# Altium project Battery_Monitor_V2.PrjPcb
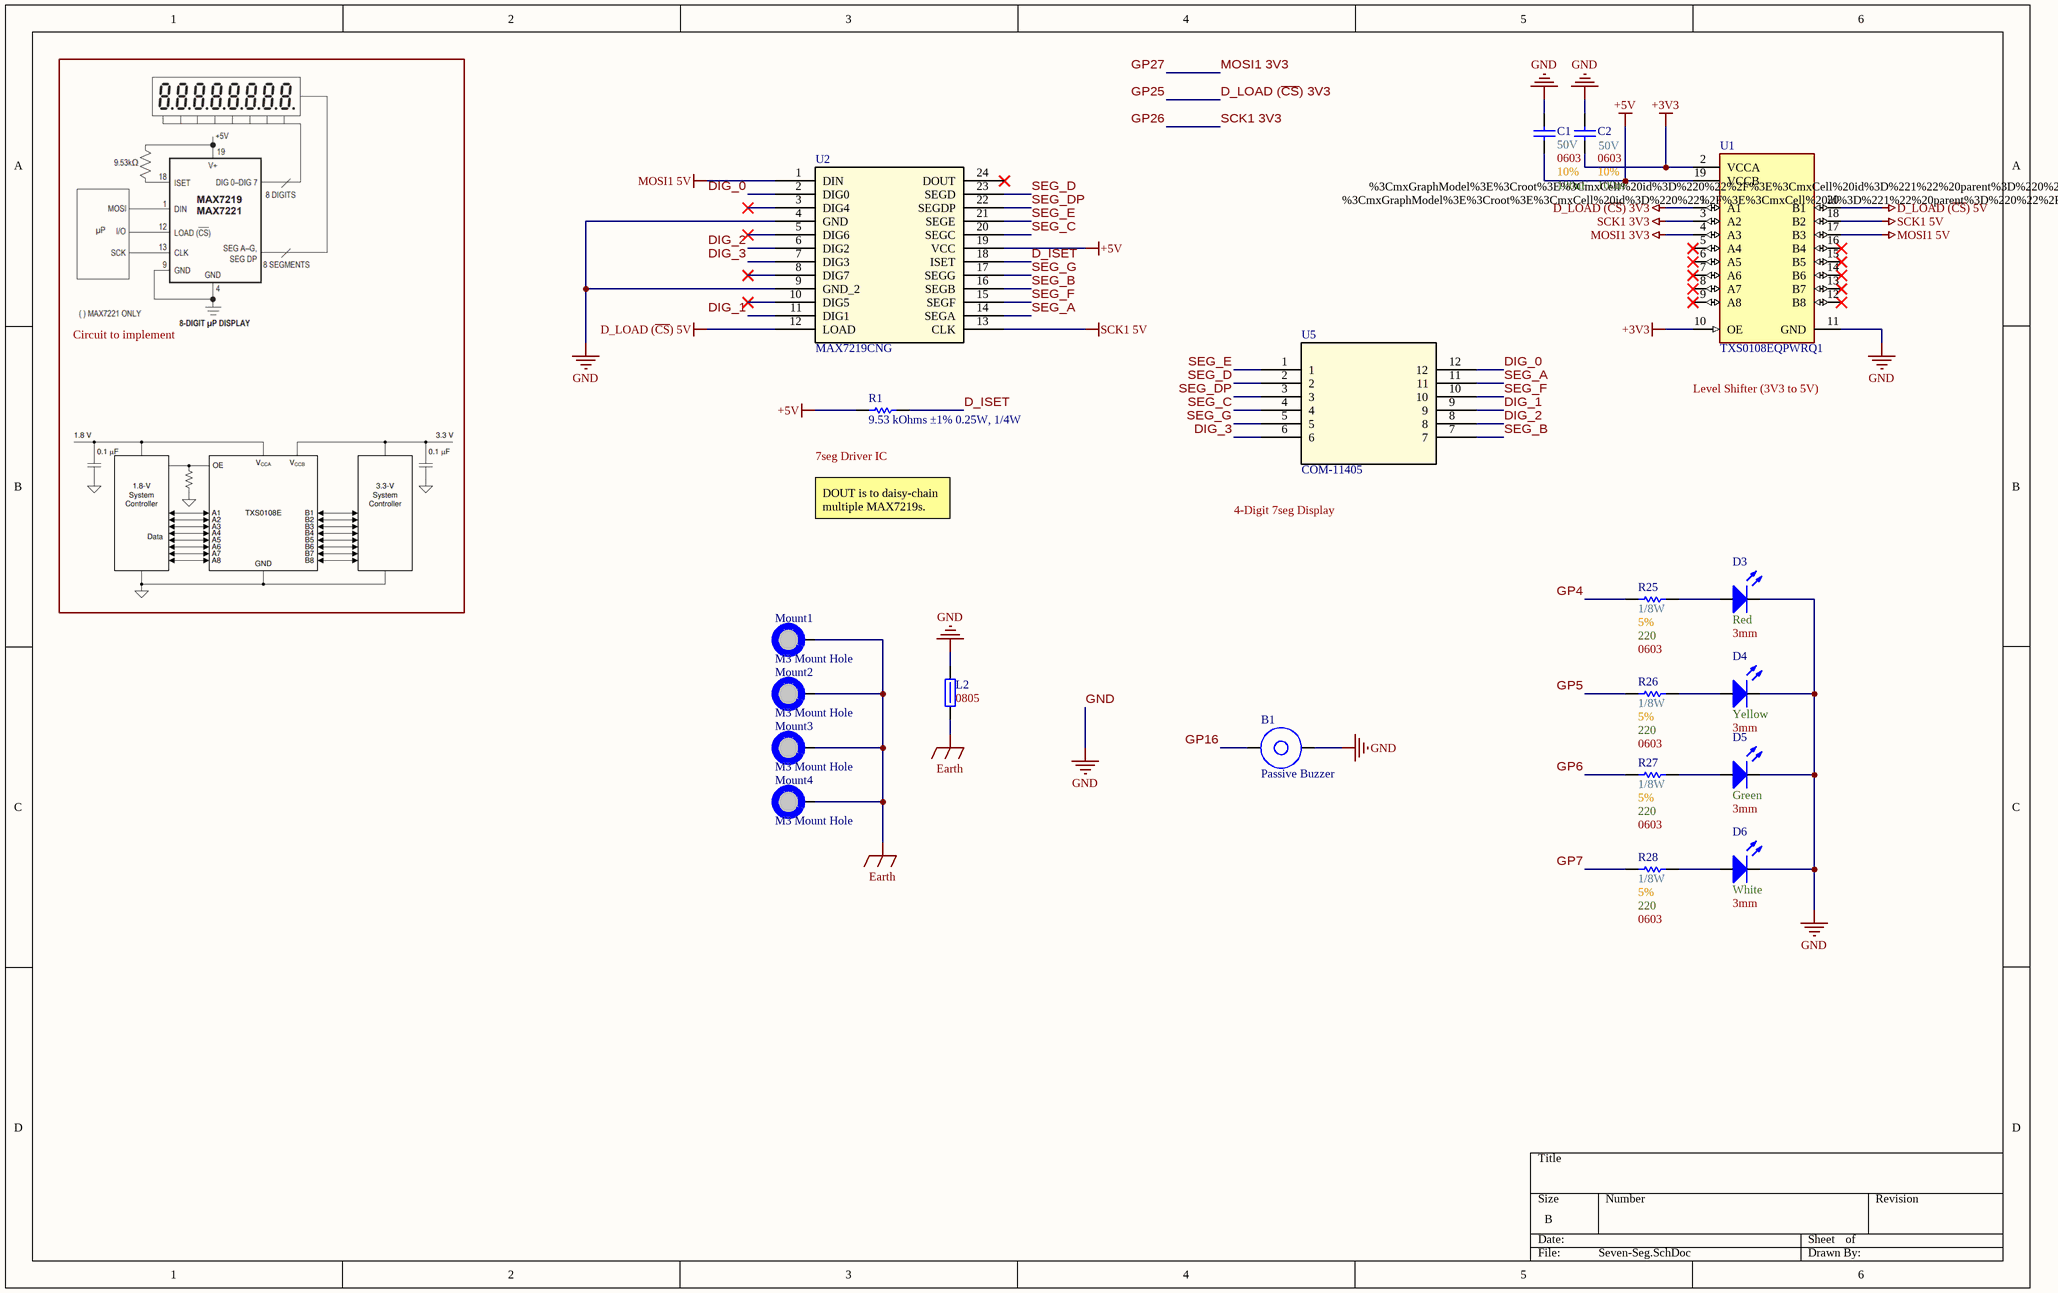
[diagram p0: Seven-Seg.SchDoc]
4 sheets, 99 parts. Net scope: global (net labels, ports and power ports of the same name join across sheets).
Board file: PCB1.PcbDoc
Sheets:
  Seven-Seg.SchDoc
  Battery-Voltage.SchDoc
  RP2350A.SchDoc
  Battery-Current.SchDoc

## Sheet Seven-Seg.SchDoc
size B; SheetNumber: 1; SheetTotal: 4

### Parts
B1  Passive Buzzer  [[Buzzer] Passive Thru-Hole 3V 30mA]
C1  Max Voltage: 50V  Size Package: 0603  Tolerance: 10%  Capacitance: 100nF  [[Cap] SMD 0603]  (hidden comment: [Cap] 0603 0.1uF 10% 50V)
C2  Max Voltage: 50V  Size Package: 0603  Tolerance: 10%  Capacitance: 100nF  [[Cap] SMD 0603]  (hidden comment: [Cap] 0603 0.1uF 10% 50V)
D3  Color: Red  Lens Diameter: 3mm  [[LED] Thru-Hole 3mm Red]  (hidden comment: [LED] Thru-Hole 3mm Red)
D4  Color: Yellow  Lens Diameter: 3mm  [[LED] Thru-Hole 3mm Yellow]  (hidden comment: [LED] Thru-Hole 3mm Yellow)
D5  Color: Green  Lens Diameter: 3mm  [[LED] Thru-Hole 3mm Green]  (hidden comment: [LED] Thru-Hole 3mm Green)
D6  Color: White  Lens Diameter: 3mm  [[LED] Thru-Hole 3mm White]  (hidden comment: [LED] Thru-Hole 3mm White)
L2  Size Package: 0805  [[Ferrite] SMD 0805]  (hidden comment: 652-MH2029-300Y)
Mount1  M3 Mount Hole  [[Mount] M3 Mount Hole]  (no BOM)
Mount2  M3 Mount Hole  [[Mount] M3 Mount Hole]  (no BOM)
Mount3  M3 Mount Hole  [[Mount] M3 Mount Hole]  (no BOM)
Mount4  M3 Mount Hole  [[Mount] M3 Mount Hole]  (no BOM)
R1  9.53 kOhms ±1% 0.25W, 1/4W  [RESC2013X60X30LL20T20]
R25  Wattage: 1/8W  Tolerance: 5%  Resistance: 220  Size Package: 0603  [[Res] SMD 0603]  (hidden comment: [220] SMD 0603 5% 1/10W)
R26  Wattage: 1/8W  Tolerance: 5%  Resistance: 220  Size Package: 0603  [[Res] SMD 0603]  (hidden comment: [220] SMD 0603 5% 1/10W)
R27  Wattage: 1/8W  Tolerance: 5%  Resistance: 220  Size Package: 0603  [[Res] SMD 0603]  (hidden comment: [220] SMD 0603 5% 1/10W)
R28  Wattage: 1/8W  Tolerance: 5%  Resistance: 220  Size Package: 0603  [[Res] SMD 0603]  (hidden comment: [220] SMD 0603 5% 1/10W)
U1  TXS0108EQPWRQ1  [FP-PW0020A-MFG]
U2  MAX7219CNG  [21-0043D_24_MXM]
U5  COM-11405  [COM-11405_SPK]

### Nets
+3V3: C2.1 U1.2(VCCA) U1.10(OE)
+5V: C1.1 R1.1 U1.19(VCCB) U2.19(VCC)
D_LOAD (~{CS}) 3V3: U1.1(A1)  [also labelled GP25]
D_LOAD (~{CS}) 5V: U1.20(B1) U2.12(LOAD)
Earth: L2.2 Mount1.1 Mount2.1 Mount3.1 Mount4.1
GND: B1.2(-) C1.2 C2.2 D3.2(Cathode) D4.2(Cathode) D5.2(Cathode) D6.2(Cathode) L2.1 U1.11(GND) U2.4(GND) U2.9(GND_2)
MOSI1 3V3: U1.4(A3)  [also labelled GP27]
MOSI1 5V: U1.17(B3) U2.1(DIN)
SCK1 3V3: U1.3(A2)  [also labelled GP26]
SCK1 5V: U1.18(B2) U2.13(CLK)
D_ISET: R1.2 U2.18(ISET)
DIG_0: U2.2(DIG0) U5.12
DIG_1: U2.11(DIG1) U5.9
DIG_2: U2.6(DIG2) U5.8
DIG_3: U2.7(DIG3) U5.6
GP4: R25.1
GP5: R26.1
GP6: R27.1
GP7: R28.1
GP16: B1.1(+)
SEG_A: U2.14(SEGA) U5.11
SEG_B: U2.16(SEGB) U5.7
SEG_C: U2.20(SEGC) U5.4
SEG_D: U2.23(SEGD) U5.2
SEG_DP: U2.22(SEGDP) U5.3
SEG_E: U2.21(SEGE) U5.1
SEG_F: U2.15(SEGF) U5.10
SEG_G: U2.17(SEGG) U5.5
NetD3_1: D3.1(Anode) R25.2
NetD4_1: D4.1(Anode) R26.2
NetD5_1: D5.1(Anode) R27.2
NetD6_1: D6.1(Anode) R28.2

Not connected (* = marked no-connect by the designer): U1 5(A4)* 6(A5)* 7(A6)* 8(A7)* 9(A8)* 12(B8)* 13(B7)* 14(B6)* 15(B5)* 16(B4)*; U2 3(DIG4)* 5(DIG6)* 8(DIG7)* 10(DIG5)* 24(DOUT)*

### Notes on the sheet
- %3CmxGraphModel%3E%3Croot%3E%3CmxCell%20id%3D%220%22%2F%3E%3CmxCell%20id%3D%221%22%20parent%3D%220%22%2F%3E%3CmxCell%20id%3D%222%22%20parent%3D%221%22%20style%3D%22shape%3Dimage%3BverticalLabelPosition%3Dbottom%3BlabelBackgroundColor%3Ddefault%3BverticalAlign%3Dtop%3Baspect%3Dfixed%3BimageAspect%3D0%3Bimage%3Ddata%3Aimage%2Fpng%2CiVBORw0KGgoAAAANSUhEUgAAAL4AAADECAYAAAAhzZs6AAAAAXNSR0IArs4c6QAAAARnQU1BAACxjwv8YQUAAAAJcEhZcwAAEnQAABJ0Ad5mH3gAABu5SURBVHhe7d17WFT1vsfxjzMKhEPAcGdUrnJRA4EIEy%2Bp%2B1jtNgTm8QiashMlE3aJJngShK2BYiFna7azsq25rUzzqVQ6bjUuSSpIQjvTyUE4KVchLiK3mfmePwaRWQmSghrr%2B3qeeXqe9Vuz1tB6z%2FSbH9oaQkSEQaSwsBCRkZEoLCwUDg0agYGBSEtLQ2BgoHCI9ZFEuIExMeDwmShx%2BEyUOHwmShw%2BEyUOn4lSn8LXNpSiIPsYvj5dggaNcFRHW%2F09ck5fwjWtcIQ9CNrrlDh1%2FCiOn1SiVn1zu%2FZaJVRKJZRKJZRKFcoqG9BtGGitQamqovuWTu1oamoTbuykxbVKVecxlVCVVaC%2Bvdvw9RpcUl1CzfVu2wBcr74EVWktWvU3DwzqlZrKPnuJ%2FGzs6ZFpM2mKpw1Z%2BkbT51c0gt1U9M4fLWmoTQR90aI%2FdK%2BdOXOGfHx8hJsHlYkTJ9I333wj3NyDJsrPCKXRchtyD5hEEzztSO4aQptPNxERUfO%2BMDIfZkK2Do7k6OhACrmMzN2epoTMclITUVvuK%2BQmC%2Bk6WltVIe1%2FI5qCvRXkvfIEtXU7003NtC%2FMnIaZ2JKDoyM5KCzJxNSBnnh5P5Woiagpl1aMk5F7zFFq7HyGpi6TokbLyOe1b6lZcLSB0Hv4LV%2FREgd7Ct15mTRERK1FlOxvQr5JRdTRtZOaSt8PIQfZQyTl8O%2BJ3xK%2BWpVOU008aNnROt011DTSqQR%2FMhufQPltuvAt7BfRwRvXTV1LJ5Ink7ldOH1aq9EPv%2BUgRbqMoseei6bwR03JY0Vv4VuQ%2FaKDpDushpqKM%2BgpG0t6bvdV0pCG6v%2B1jNxNvGl1XjMRNVHOinFkMjaWsnTvxwHX%2B1RHLcfkpSlYFWynmxMZusHLwxhNtb%2FgxoxH8%2FNHWLmhGn9eH44RUv2ns%2FtPU1WOKq0d3NxMdddQYgK%2FqFSkzB0HA%2BHOACCVY2L085jQWIC8c3qTHsBgGjafLcGpfRsR6jpMf6xXEsjGPo9Zvtdx%2FnsV1JDAdHoyNs1pxNsrMlDw7SYsf68N899Yg8ky4XMHRu%2Fhy%2FwxP24hJpjpdtNWH8L%2BHBNMD%2FKDIQBoK7Av7q%2F4v7AMvDxmqPDZ7AFg4BuOBT5FSAqaj3W7c6Cq10CqmIGlcXPgdcvygevnzqMUlrC1FnySSYwhk93Zp5v68mEcKTaG2xhHDAUAiQWeeX0TnrmShqeCNqN21iYkzzS%2FTZD9p%2B%2FnUSvxQVQs8qakYu0MGQAtqg%2BsRsKFWUhf5Y%2BHhPuzB4OhD%2BIyc7E9RIIjiUHwHOGMKYu3IK%2Fm5iqEtiYbW5bHICYmGi9GBCFw1g5II%2BKxwPXOItfRouqLVzHzial4zNUMRk4xuPjHLUgLt%2B6KTmLzNF74kwXq623xbMSTsOp7jXetb6fSViMzdg6S6pZgz7bZsJMA2pqDWB2Xg0dj5sLqihIXy67ievNVlKlKUXNPvpazvpLIxmB20m7kllRAeWgNxhUnIyhsKy50rdAZQW6vgEIxEq5%2BoVj7ZTHytwbBtm919GioxyzErUnA2qgpsBo%2BDuHLZ8O128Sg%2Fd9vIWlPKzw9GrEz6W38KJhZDSjhpP%2FXrlH%2Bhmk00msZHay8uZrT8sXL5PfII%2FRI52PsSDOSSMxopFcwvVl086vvvcZfbrtT05Uv19FLb35N9d0W4tpyl5Pb8CfpnWrNr7%2FcCghXdXSa6dO5ln3%2Fcqsppw9n2ZIifC9V3Xgd6gu05Q8WZPvcLipTvUt%2FsrakJ7ddJLX%2BgQbMbd7Taqh2RiDsPWusP5CBZ2xu7m4UlIGC4mIUdz7OvP9fGGkbgrdOfY5YL57vPxikMDWqwJGURKTnVurW57UNKM4qQLW1C1wevs3l7y8SO8xdEwWbQ68jI78VgAaXdsRiXZE%2FktLCMcr5z3jjNW%2FkJ6%2FArrIeflHUz3r%2FyduOYeOaAyj9%2BTD%2B4mcFc3Nz3cNuPvYKfvnAHkzDp2%2FAxykuyAzzgM1IFzgrHDBzlxli31%2BLaYbCvQfOUO8Y%2FHfQVbyTvBOq0j1YufYExsSnY5GzFIAU7i9uxirXLCSs2ovye%2FBL0CHEfxHld%2BfO%2FiJKK%2BrKylCttYSjkwWMhMMi0%2FsnPhtEjCB3cIcHRw9w%2BEysOHwmShw%2BEyUOn4kSh89EicNnosThM1Hi8JkocfhMlDh8JkocPhMlDp%2BJEofPRInDZ6LE4TNR4vCZKHH4TJQ4fCZKHD4TJQ6fiRKHz0SJw2eixOEzUeLwmShx%2BEyUOHwmShw%2BEyUOn4kSh89EicNnosThM1Hi8JkocfhMlDh8JkocPhMlDp%2BJEofPRInDZ6LE4TNR4vCZKHH4TJQ4fCZKHD4TJQ6fiRKHz0SJw2eiNOTAgQMk3Ph7plKp8NZbbyE9PV04NGjEx8dj4cKF8PT0FA6xPhry7LPPDqrw6%2BvrcfbsWTzxxBPCoUEjJycHY8eOhYWFhXCI9dEQIhpU4RcWFiIyMhKFhYXCoUEjMDAQaWlpCAwMFA6xPuI5PhMlDp%2BJEofPRInDZ6LE4TNR4vCZKHH4TJQ4fCZKfQpf21CKguxj%2BPp0CRo03QeuoVKlhFJ583GxvAHabruwB0N7nRKnjh%2FF8ZNK1Kpvbtdeq4Sq6%2FqpUFbZgG7DQGsNSlUV3bd0akdTU5tw46%2B0VZ1D3rHjyPmuDE2%2FCqMddcpTOH70OE4qa%2FXPO9CoV2oq%2B%2Bwl8rOxp0emzaQpnjZk6RtNn1%2FR6IabPqQQmQE9ZGpGZma6h%2FXsnfSL8DD30JkzZ8jHx0e4eVCZOHEiffPNN8LNPWii%2FIxQGi23IfeASTTB047kriG0%2BXQTERE17wsj82EmZOvgSI6ODqSQy8jc7WlKyCwnNRG15b5CbrKQrqO1VRXS%2FjeiKdhbQd4rT1BbtzPp0VTQV2um00hzBT3y%2BETydZKTpc8S%2BkSl1o035VNG6GiS27hTwKQJ5GknJ9eQzdT5sgZc7%2BG3fEVLHOwpdOdl0hARtRZRsr8J%2BSYVUQcRqX%2FaSIEWs%2Bmja8In3j8cvj61Kp2mmnjQsqN1umuoaaRTCf5kNj6B8tt04VvYL6KDLTeeUEsnkieTuV04fVqr0Q%2B%2F5SBFuoyix56LpvBHTcljRU%2Fha6j8w%2BfIThFMb%2F%2FQeeCOMto9ZwRZBX9AVzRqUqVPJROPZXS0Tvchqmk8RQn%2BZjQ%2BIV%2F%2FUAOk96mOWo7JS1OwKthONycydIOXhzGaan%2BBBoCmogJXLexhN1T4RPag0FSVo0prBzc3U901lJjALyoVKXPHwUC4MwBI5ZgY%2FTwmNBYg75xg8mEwDZvPluDUvo0IdR2mP9ad9go%2B%2B8cRWEUk4oUxRrptQ0fhP1fG4g%2BG1Sjt0KCqvApaOze4meoSlJj4ISo1BXPHGUBzaReiglbhb1tfxAwvFziPfQJL%2FvEDWvXPcld6D1%2Fmj%2FlxCzHBTLebtvoQ9ueYYHqQHwwBqCsrUV2bieVedjC3csKjczYgq%2FpXEzl2Hxn4hmOBTxGSguZj3e4cqOo1kCpmYGncHHjdsnzg%2BrnzKIUlbK2l%2BgMSY8hkgm230vETzpUMhYeXp96by8B%2FOfbsXYWJhgbwDV8An6IkBM1fh905KtRrpFDMWIq4OV6g5lKc%2Bd%2B38N5Zf6z9%2BDA%2BjDTBoRVr8dkv%2FddW7%2BF3p1big6hY5E1JxdoZMt02p%2BlYMD8SSXvzUHD4dQRcTMX8V79AP74%2BdrcMfRCXmYvtIRIcSQyC5whnTFm8BXk1Ny%2BStiYbW5bHICYmGi9GBCFw1g5II%2BKxwLUPkd8KtaKt3QCGhj3nZegTh8zc7QiRHEFikCdGOE%2FB4i156HpZhlMRk7YIU8a4I%2FCFWfBtL8VPl%2FsvrJ5fWXfaamTGzkFS3RLs2TYbdp3PMn50MTIyViHY2wku%2FuHYuCYY2uxMFHQID8DuJ4lsDGYn7UZuSQWUh9ZgXHEygsK24kLXCp0R5PYKKBQj4eoXirVfFiN%2FaxBs%2B1bHrw0xhrFRG643d18CFJJANmY2knbnoqRCiUNrxqE4OQhhWy90jkshvfG%2BGyqFFFpo%2B6%2F7voTfjIJNcxGVPQl%2F37saAZ0f9kA7Lhx%2BHwfO3ly%2BHGZqAqOOdrQOqj%2Fh%2F3umQfnB9ViWnoUGLQAYw3HqYmS8uQCWJw8ju0535SRWAZj3ajzi4%2BOwMuYFhASMROfM%2FM4M84SXO%2FDvM9%2Bhvdvm1uOrMXnSanx9vRwH1y9DelZnO8aOmLo4A28usMTJw9ndnjFwbhO%2BGqqdEQh7zxrrD2TgGRv93Rvz%2FoYXX%2F0A59sAaGtw7JNjaPB%2BHL49zB3ZvSaFqVEFjqQkIj23UrdOrm1AcVYBqq1d4PLwbS7%2FnZJYIXRxMFp3JyI9vx5aANqmImzbsANlLgEYb2QKo4ojSElMR26l7gu0tqEYWQXVsHZxER5tQPT%2Bk7cdw8Y1B1D682H8xc8K5ubmuofdfOy9bgC%2FFVvx8tD%2FwVQnN3g6e%2BD5XD%2BkbloARe9HZffQ8Okb8HGKCzLDPGAz0gXOCgfM3GWG2PfXYpqhcO%2F%2BIoFF8P%2Fg43g5PnzKCSOcXaEY9QS2Gy%2FHP9ODYS4ZjukbPkaKSybCPGww0sUZCoeZ2GUWi%2FfXThMebGAI1zd%2FOw01V5XQhYtV9CAs5%2FM6fk9aqLb0PP1YcpVuLNnfEy3VVPLjOSqp7uGsLbVUev5HKrnaw%2FgA6YfPZgmMrZ3g5mKN4cIh9gAxgtzBHR5OFnc3f%2F%2BtjKzg5OEJJ6sezmokh4O7B5wsehgfIP0QPmO%2FPxw%2BEyUOn4kSh89EicNnosThM1Hi8JkocfhMlDh8JkocPhMlDp%2BJEofPRInDZ6LE4TNR4vCZKHH4TJQ4fCZKHD4TJQ6fiRKHz0SJw2eixOEzUeLwmShx%2BEyUOHwmShw%2BEyUOn4nSEKlUOqj%2Bb%2FZEBK1WC2nXXQUGH41GA4lEgiFDhgiHWB8N6ejoGFThFxYWIioqCvn5%2BcKhQWPKlClITU1FYGCgcIj10RAiGnThR0ZGorCwUDg0aAQGBiItLY3Dvws8x2eixOEzUeLwmShx%2BEyUOHwmShw%2BEyUOn4lSn8LXNpSiIPsYvj5dgoYe7tKubqrElZrmrrucswdLe50Sp44fxfGTStTq7qkMANBeq4RKqYRSqYRSqUJZZYPuRtA3tNagVFXRfUundjQ1tQk36muvg%2FLUcRw9fhLK7ift0oaqc3k4djwH35U13WxHew2VqhJUNXevqQ11ZRehqrzWP40J7%2F%2BpT01ln71Efjb29Mi0mTTF04YsfaPp8yuarj2ainfSsmnOZCaTk%2FerX1Or3vPvPb7PrVAT5WeE0mi5DbkHTKIJnnYkdw2hzaebiIioeV8YmQ8zIVsHR3J0dCCFXEbmbk9TQmY5qYmoLfcVcpOFdB2traqQ9r8RTcHeCvJeeYLaup2pu6b8DAodLScb9wCaNMGT7OSuFLL5NOnOSqSp%2BIrWTB9J5opH6PGJvuQktySfJZ%2BQSk1EzfsozMKeFh28ce%2FbDir5MIycLCdQYu4vdLO%2BO9d7%2BC1f0RIHewrdeVl3stYiSvY3Id%2BkIuogIk31fopwtKepr31JF5v64%2BXcPQ5fn1qVTlNNPGjZ0TrdNdQ00qkEfzIbn0D5bbrwLewXUVdj6lo6kTyZzO3C6dNajX74LQcp0mUUPfZcNIU%2FakoeK3oIX62i9Kkm5LHsKNXpTkqNpxLI32w8JeS3EWnK6cPn7EgR%2FDb90HnejrLdNGeEFQV%2FcIU0euFrqPrIKzRe7kaLPrtMasGp7lTvUx21HJOXpmBVsJ1uTmToBi8PYzTV%2FgINNFDueBOZHonYlfwnuMh6PxS7PzRV5ajS2sHNzVR3DSUm8ItKRcrccTAQ7gwAUjkmRj%2BPCY0FyDsnmJ4YTMPmsyU4tW8jQl2H6Y91p6lCeZUWdm5uMNWdFCZ%2BUUhNmYtxBoD2ymf4xxErRCS%2BgDGd93UeOuo%2FsTL2DzCsLkVHt0M1f%2Fcm5j7%2FCeyS92NrqAL99UcPe69V5o%2F5cQsxwUy3m7b6EPbnmGB6kB8MtXX4Jvt7yKV5WOzjAGsbZzy%2BcBsKmvplBsb6iYFvOBb4FCEpaD7W7c6Bql4DqWIGlsbNgdctyweunzuPUljC1lqQmcQYMlkf0jPwRfgCHxQlBWH%2But3IUdVDI1VgxtI4zPEyQMdP51Ay1ANent1fgAH8l%2B%2FB3lUTYdi5RXN5DxbNSkZN%2BD%2Fxz5fG9esd2XsPvzu1Eh9ExSJvSirWzpAB2nL8XNmKyxUmWLjzW1w4vRUTf3gNC9edxG2%2B8rB7ydAHcZm52B4iwZHEIHiOcMaUxVuQV3PzA0pbk40ty2MQExONFyOCEDhrB6QR8Vjg2ofIb8kQPnGZyN0eAsmRRAR5joDzlMXYklcDLQBqbUO7gSEMe6tPW4mPXl6GvWXtaGlsRLtw%2FC71duqbtNXIjJ2DpLol2LNtNuwkALRtaGs3wBMxqQj3sYe5w1OIj3ocl4%2F9L87f6gs8u28ksjGYnbQbuSUVUB5ag3HFyQgK24oLXSt0RpDbK6BQjISrXyjWflmM%2FK1BsO1bHbcmkWHM7CTszi1BhfIQ1owrRnJQGLZe0GCIsTGM2q6juYcVQh0JbJ99Fz%2BcScGIA8uwdOcl9Lr7b9SHH60ZBZvmIip7Ev6%2BdzUCZJ2bpTawtZTgWkN95%2FKSBA8NfwgStRodPNt5QGhQfnA9lqVnoUELAMZwnLoYGW8ugOXJw8iu67xyVgGY92o84uPjsDLmBYQEjLyraYWm%2FCDWL0tHlu6kMHacisUZb2KB5Ukczq7DME8vuOPfOPNd98%2FxVhxfPRmTVn%2BtmzFILPDEvNnw9FmO9994FKdXvoD04v6bS9wmfDVUOyMQ9p411h%2FIwDM23XaXjsDTQb74%2Fh8ZyK7RAu0l%2BHjvSZgFTIbe1I3dR1KYGlXgSEoi0nMrdevz2gYUZxWg2toFLg%2Ff5vLfIampESqOpCAxPReVupOioTgLBdXWcHF5GBKrUCwObsXuxHTk12sBaNFUtA0bdpTBJWA8dF%2BbpRgq1f3TeeE72Bp6Ga8vSEBO55vprgmXefS0fkWLR0hpqKEJmZqZkdmNh%2B08%2BqSZiFq%2Bp3fDPMnCwoFGK%2BRkH7iKDlXc32VNXs4U0DRSwTsR5G9nSvIRzuRka0rmo4Por8erSNO5jq%2B3nCkgXMfXaaZP51r2vJxJGmoseIci%2FO3IVD6CnJ1sydR8NAX99ThVdeah%2BeVbSn9uDMnN7MjJxZbMzNzp2dQcuqp7UYJ1fCJNfRa96mVKrosOUH8k1nv4faKmpvKf6Pylq%2Ff9l1fE4feihWpLz9OPJVeph8YHREttKZ3%2FsYSu9nDSluoS%2BvFcCVX3MD5Q%2BuG%2FdVLI7Fzh7mjRtQzFHkRGkDu4w8PJ4q7m77%2BVkdwB7h5OsOjhpEZWTvDwdIJVD%2BMDpR%2FCZ%2Bz3h8NnosThM1Hi8JkocfhMlDh8JkocPhMlDp%2BJEofPRInDZ6LE4TNR4vCZKHH4TJQ4fCZKHD4TJQ6fiRKHz0SJw2eixOEzUeLwmShx%2BEyUOHwmShw%2BEyUOn4kSh89EicNnosThM1EaMnfuXBJu%2FD2rq6vD6dOn8dRTTwmHBo2jR4%2FC29sbVlZWwiHWR0M%2B%2BuijQRX%2BpUuXsH37dqSmpgqHBo3ExETMmzcP7u7uwiHWR0OIaFCFX1hYiMjISBQWFgqHBo3AwECkpaUhMDBQOMT6iOf4TJQ4fCZKHD4TJQ6fiRKHz0SJw2eixOEzUepT%2BNqGUhRkH8PXp0vQcOO%2B6q01KL2ohFIpeJRUobmf7sHL%2Bk97nRKnjh%2FF8ZNK1Kpvbtdeq4Sq6%2FqpUFbZoLsR9A2tNShVVXTf0qkdTU23utO4Fg3lFzuP9wNOZ%2F0LOWd%2B7Dp%2B5bVrqLmkwqWa6%2FpPu16NS6pS1Lbqbx4wwvt%2F6lNT2WcvkZ%2BNPT0ybSZN8bQhS99o%2BvyKhjrOptEfx3qQh8eNhzu52T9MQ0e%2FQjn38Ya3fJ9boSbKzwil0XIbcg%2BYRBM87UjuGkKbTzcRdd7g2XyYCdk6OJKjowMp5DIyd3uaEjLLSX2LGzy3VRXS%2FjeiKdhbQd4rb3WD53r65M9u5OjoSI4OVjR8CEgisyYHR0dydPKhV76qodwV40jmHkNHGzufoqmjzKjRJPN5jb5tFhxugPQefstXtMTBnkJ3XiYNEVFrESX7m5BvUhF1CPfV1NH%2B50fR%2BDX5t%2FiXce9w%2BPrUqnSaauJBy47W6a6hppFOJfiT2fgEym%2B7xZ3N1bV0InkymduF06e1Gv3wWw5SpMsoeuy5aAp%2F1LSXO5t36iimJL%2FhNHOb7i7qN2jq%2F0XL3E3Ie3UeNRNRU84KGmcylmKzdG%2FGe6H3qY5ajslLU7Aq2E43JzJ0g5eHMZpqf8GNGc8Nmku7sPWYJ5ZE%2BsBAMMbuH01VOaq0dnBzM9VdQ4kJ%2FKJSkTJ33K2vk1SOidHPY0JjAfLO6U16AINp2Hy2BKf2bUSo6zD9sd9AYjodyZvmoPHtFcgo%2BBablr%2BHtvlvYM1kmXDXAdN7%2BDJ%2FzI9biAlmut201YewP8cE04P8BHcxb8O3b7%2BDS%2F%2BxFGEOUr0Rdn8Z%2BIZjgU8RkoLmY93uHKjqNZAqZmBp3Bx43bJ84Pq58yiFJWytBddSYgyZrD%2BurwQWz7yOTc9cQdpTQdhcOwubkmfCvPca%2B1XfT6VW4oOoWORNScXaGfrvTG3NfvztIwOEvfQ0zPRG2H1n6IO4zFxsD5HgSGIQPEc4Y8riLcirubkCoa3JxpblMYiJicaLEUEInLUD0oh4LHDtj8h7ILHB0y%2F8CRb19bB9NgJPWvU9xf7Qt7Npq5EZOwdJdUuwZ9ts2Ok9S40L77%2BFrLGRWOLXw0cIu68ksjGYnbQbuSUVUB5ag3HFyQgK24oLXfNVI8jtFVAoRsLVLxRrvyxG%2FtYg2PatjjvT%2Fm%2B8lbQHrZ4eaNyZhLd%2FFEyrBlgffrRmFGyai6jsSfj73tUIEE7DmrOxdUcZnnxxHkYN4AcEuxMalB9cj2XpWWjQAoAxHKcuRsabC2B58jCy63Sf%2BhKrAMx7NR7x8XFYGfMCQgJGwkh4qH6lgXL7cmz8aQY2HPoC6yf9gJTl70Il%2FOI4gG4TvhqqnREIe88a6w9k4Bkb4e5alH%2FyN%2BwzmIdlz5jf7mDsnpPC1KgCR1ISkZ5bqVuf1zagOKsA1dYucHn4%2FlwxzaUdiF1XBP%2BkNISPcsaf33gN3vnJWLGr7FeLJgOl95%2B87Rg2rjmA0p8P4y9%2BVjA3N9c97OZj73UA6u%2Fx7rYTGLskCv7633bZA2L49A34OMUFmWEesBnpAmeFA2buMkPs%2B2sx7X5cM83P2LNyLU6MiUf6ImdIAUjdX8TmVa7ISliFveX35ref%2FDewfofu7G9gtaKurAzVWks4OlkM8FTmwdf7Jz4bRIwgd3CHB0cPcPhMrDh8JkocPhMlDp%2BJEofPRInDZ6LE4TNR4vCZKHH4TJQ4fCZK%2Fw%2BAfBs0mVwulgAAAABJRU5ErkJggg%3D%3D%3B%22%20value%3D%22%22%20vertex%3D%221%22%3E%3CmxGeometry%20height%3D%2280%22%20width%3D%2277.55%22%20x%3D%22200.61%22%20y%3D%22280%22%20as%3D%22geometry%22%2F%3E%3C%2FmxCell%3E%3C%2Froot%3E%3C%2FmxGraphModel%3E
- Circuit to implement
- Level Shifter (3V3 to 5V)
- (near R1) 7seg Driver IC
- DOUT is to daisy-chain multiple MAX7219s.
- 4-Digit 7seg Display

### Library data of the parts
B1 = [Buzzer] Passive Thru-Hole 3V 30mA: AI-1223-TWT-3V-2-R; Supplier 1: DigiKey; Supplier Part Number 1: 668-1456-ND
C1 C2 = [Cap] 0603 0.1uF 10% 50V: GCM155R71H104KE02J; Supplier 1: DigiKey; Supplier Part Number 1: 490-14514-6-ND
D3 = [LED] Thru-Hole 3mm Red: 151031SS06000; Supplier 1: DigiKey; Supplier Part Number 1: 732-5006-ND
D4 = [LED] Thru-Hole 3mm Yellow: 151031YS05900; Supplier 1: DigiKey; Supplier Part Number 1: 732-5009-ND
D5 = [LED] Thru-Hole 3mm Green: 151031VS06000; Supplier 1: DigiKey; Supplier Part Number 1: 732-5008-ND
D6 = [LED] Thru-Hole 3mm White: 151031VS06000; Supplier 1: DigiKey; Supplier Part Number 1: 1516-QBL7IW60D-WW-ND
L2 = [Ferrite] SMD 0805 3A 30ohm: Res @ Freq: 30 @ 100MHz; Supplier 1: DigiKey; Supplier Part Number 1: MH2029-300YCT-ND
Mount1-Mount4 = [Mount] M3 Mount Hole: Place at least 4.5mm from board edge. Plated.
R1 = CMP-2001-01986-1: RK73H2ATTD9531F; Manufacturer: KOA Speer; Part Number: RK73H2ATTD9531F
R25-R28 = [220] SMD 0603 5% 1/10W: RK73B1JTTD221J; Supplier 1: DigiKey; Supplier Part Number 1: 2019-RK73B1JTTD221JDKR-ND
U1 = CMP-04899-000001-1: IC TRNSLTR BIDIRECTIONAL 20TSSOP; Manufacturer: Texas Instruments; Standoff Height: 0.05mm; Number Of Circuits: 1; V A Max: 3.6V; Automotive Grade: Grade 1; Number Of Inputs: 8; Max Junction Temp: +150°C; V A Min: 1.4V; Nominal Supply Current: 8uA; Logic Function Desc: Non-inverting; V B Max: 5.5V; V B Min: 1.65V; Data Rate: 110Mbits/s; Ambient Temperature Range High: +125°C; Height: 1.2mm; Temperature Range High: +125°C; ComponentLink2Description: Datasheet; Manufacturer Part Number: TXS0108EQPWRQ1; Digikey Description: IC TRNSLTR BIDIRECTIONAL 20TSSOP; Lead Free: Yes; Automotive: Yes; Number Of Outputs: 8; Temperature Range Low: -40°C; Mouser Description: Translation - Voltage Levels 8B Bidir Vltg-Level Translator ALT 595-TXS0108EPWR; Ambient Temperature Range Low: -40°C; ComponentLink2URL: http://www.ti.com/lit/ds/symlink/txs0108e-q1.pdf; Device Class L2: Logic ICs; Min Supply Voltage: 1.4V; Device Class L1: Integrated Circuits (ICs); Octopart: https://octopart.com/txs0108eqpwrq1-texas+instruments-59160487; Temperature: -40°C to +125°C; Package: PW0020A; RoHS: TRUE; Ipc Land Pattern Name: SOP65P640X120-20; Device Class L3: Voltage Level Shifters; Max Supply Voltage: 5.5V; Category: IC
U2 = MAX7219CNG: No Description Available; Manufacturer_Name: Analog Devices Inc; Copyright: Copyright (C) 2026 Ultra Librarian. All rights reserved.; Manufacturer_Part_Number: MAX7219CNG; RefDes: RefDes; Type: Type
U5 = COM-11405: Description; Manufacturer_Name: Sparkfun; Copyright: Copyright (C) 2026 Ultra Librarian. All rights reserved.; Manufacturer_Part_Number: COM-11405; RefDes: RefDes; Type: Type

## Sheet Battery-Voltage.SchDoc
size B; SheetNumber: 2; SheetTotal: 4
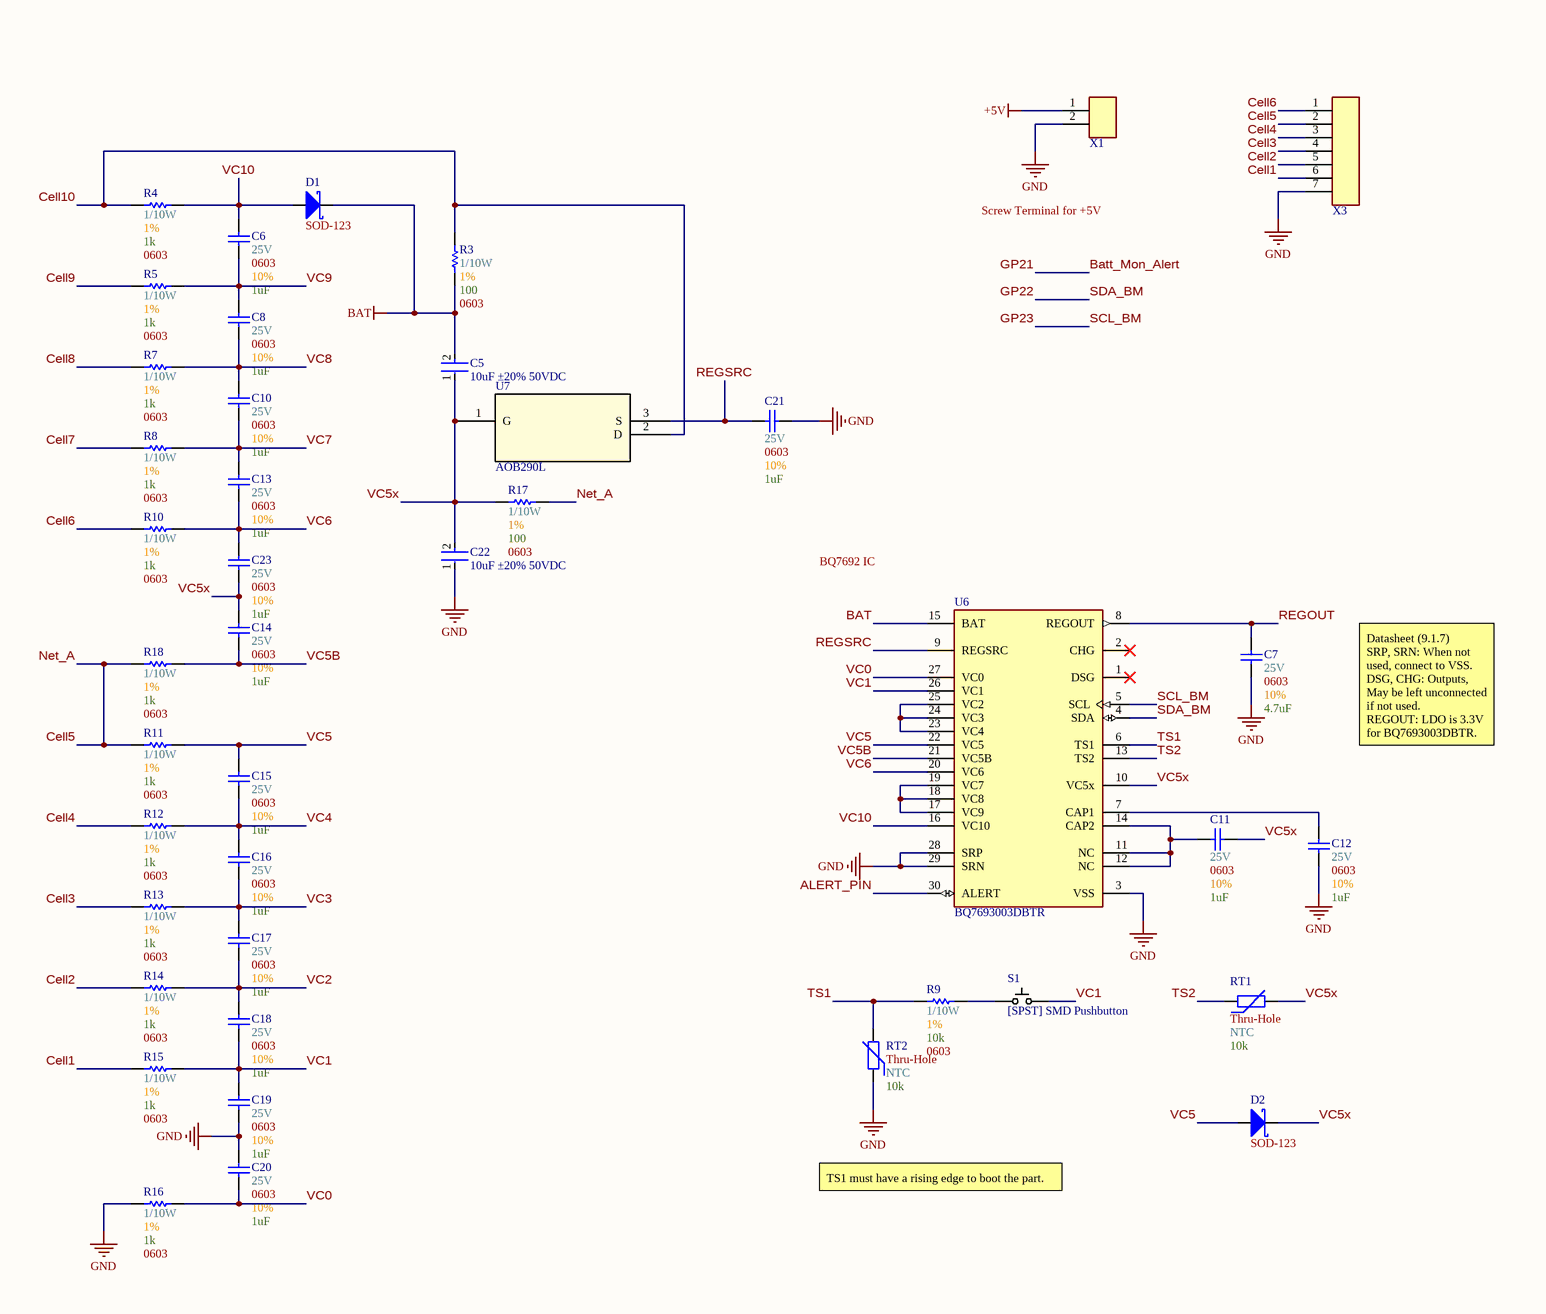
[diagram p1: Battery-Voltage.SchDoc, left]
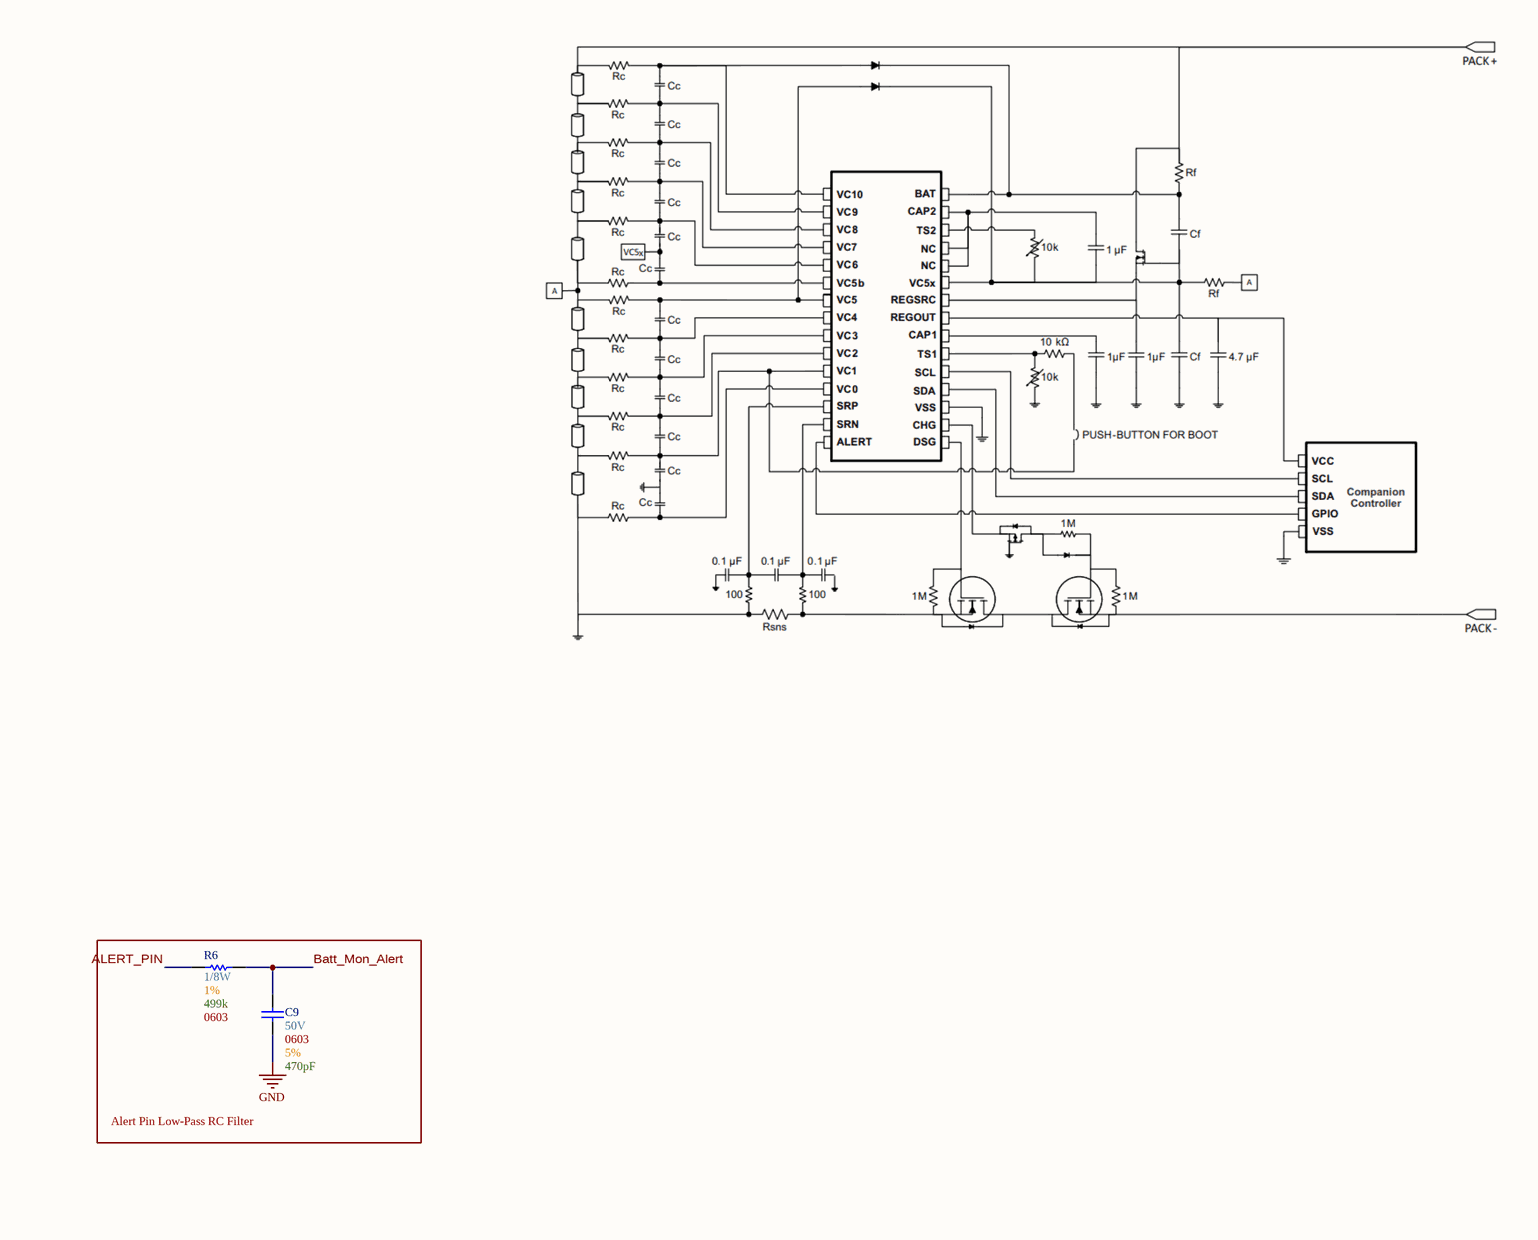
[diagram p2: Battery-Voltage.SchDoc, right]

### Parts
C5  10uF ±20% 50VDC  [FP-GCM32E-0_3-MFG]
C6  Max Voltage: 25V  Size Package: 0603  Tolerance: 10%  Capacitance: 1uF  [[Cap] SMD 0603]  (hidden comment: [Cap] 0603 1uF 10% 25V)
C7  Max Voltage: 25V  Size Package: 0603  Tolerance: 10%  Capacitance: 4.7uF  [[Cap] SMD 0603]  (hidden comment: [Cap] 0603 4.7uF 10% 25V)
C8  Max Voltage: 25V  Size Package: 0603  Tolerance: 10%  Capacitance: 1uF  [[Cap] SMD 0603]  (hidden comment: [Cap] 0603 1uF 10% 25V)
C9  Max Voltage: 50V  Size Package: 0603  Tolerance: 5%  Capacitance: 470pF  [[Cap] SMD 0603]  (hidden comment: [Cap] 0603 470pF 5% 50V)
C10  Max Voltage: 25V  Size Package: 0603  Tolerance: 10%  Capacitance: 1uF  [[Cap] SMD 0603]  (hidden comment: [Cap] 0603 1uF 10% 25V)
C11  Max Voltage: 25V  Size Package: 0603  Tolerance: 10%  Capacitance: 1uF  [[Cap] SMD 0603]  (hidden comment: [Cap] 0603 1uF 10% 25V)
C12  Max Voltage: 25V  Size Package: 0603  Tolerance: 10%  Capacitance: 1uF  [[Cap] SMD 0603]  (hidden comment: [Cap] 0603 1uF 10% 25V)
C13  Max Voltage: 25V  Size Package: 0603  Tolerance: 10%  Capacitance: 1uF  [[Cap] SMD 0603]  (hidden comment: [Cap] 0603 1uF 10% 25V)
C14  Max Voltage: 25V  Size Package: 0603  Tolerance: 10%  Capacitance: 1uF  [[Cap] SMD 0603]  (hidden comment: [Cap] 0603 1uF 10% 25V)
C15  Max Voltage: 25V  Size Package: 0603  Tolerance: 10%  Capacitance: 1uF  [[Cap] SMD 0603]  (hidden comment: [Cap] 0603 1uF 10% 25V)
C16  Max Voltage: 25V  Size Package: 0603  Tolerance: 10%  Capacitance: 1uF  [[Cap] SMD 0603]  (hidden comment: [Cap] 0603 1uF 10% 25V)
C17  Max Voltage: 25V  Size Package: 0603  Tolerance: 10%  Capacitance: 1uF  [[Cap] SMD 0603]  (hidden comment: [Cap] 0603 1uF 10% 25V)
C18  Max Voltage: 25V  Size Package: 0603  Tolerance: 10%  Capacitance: 1uF  [[Cap] SMD 0603]  (hidden comment: [Cap] 0603 1uF 10% 25V)
C19  Max Voltage: 25V  Size Package: 0603  Tolerance: 10%  Capacitance: 1uF  [[Cap] SMD 0603]  (hidden comment: [Cap] 0603 1uF 10% 25V)
C20  Max Voltage: 25V  Size Package: 0603  Tolerance: 10%  Capacitance: 1uF  [[Cap] SMD 0603]  (hidden comment: [Cap] 0603 1uF 10% 25V)
C21  Max Voltage: 25V  Size Package: 0603  Tolerance: 10%  Capacitance: 1uF  [[Cap] SMD 0603]  (hidden comment: [Cap] 0603 1uF 10% 25V)
C22  10uF ±20% 50VDC  [FP-GCM32E-0_3-MFG]
C23  Max Voltage: 25V  Size Package: 0603  Tolerance: 10%  Capacitance: 1uF  [[Cap] SMD 0603]  (hidden comment: [Cap] 0603 1uF 10% 25V)
D1  Footprint: SOD-123  [[Diode] SMD SOD-123]  (hidden comment: SOD123)
D2  Footprint: SOD-123  [[Diode] SMD SOD-123]  (hidden comment: SOD123)
R3  Wattage: 1/10W  Tolerance: 1%  Resistance: 100  Size Package: 0603  [[Res] SMD 0603]  (hidden comment: [100] SMD 0603 1% 1/10W)
R4  Wattage: 1/10W  Tolerance: 1%  Resistance: 1k  Size Package: 0603  [[Res] SMD 0603]  (hidden comment: [1k] SMD 0603 1% 1/10W)
R5  Wattage: 1/10W  Tolerance: 1%  Resistance: 1k  Size Package: 0603  [[Res] SMD 0603]  (hidden comment: [1k] SMD 0603 1% 1/10W)
R6  Wattage: 1/8W  Tolerance: 1%  Resistance: 499k  Size Package: 0603  [[Res] SMD 0603]  (hidden comment: [499k] SMD 0603 1% 1/8W)
R7  Wattage: 1/10W  Tolerance: 1%  Resistance: 1k  Size Package: 0603  [[Res] SMD 0603]  (hidden comment: [1k] SMD 0603 1% 1/10W)
R8  Wattage: 1/10W  Tolerance: 1%  Resistance: 1k  Size Package: 0603  [[Res] SMD 0603]  (hidden comment: [1k] SMD 0603 1% 1/10W)
R9  Wattage: 1/10W  Tolerance: 1%  Resistance: 10k  Size Package: 0603  [[Res] SMD 0603]  (hidden comment: [10k] SMD 0603 1% 1/8W)
R10  Wattage: 1/10W  Tolerance: 1%  Resistance: 1k  Size Package: 0603  [[Res] SMD 0603]  (hidden comment: [1k] SMD 0603 1% 1/10W)
R11  Wattage: 1/10W  Tolerance: 1%  Resistance: 1k  Size Package: 0603  [[Res] SMD 0603]  (hidden comment: [1k] SMD 0603 1% 1/10W)
R12  Wattage: 1/10W  Tolerance: 1%  Resistance: 1k  Size Package: 0603  [[Res] SMD 0603]  (hidden comment: [1k] SMD 0603 1% 1/10W)
R13  Wattage: 1/10W  Tolerance: 1%  Resistance: 1k  Size Package: 0603  [[Res] SMD 0603]  (hidden comment: [1k] SMD 0603 1% 1/10W)
R14  Wattage: 1/10W  Tolerance: 1%  Resistance: 1k  Size Package: 0603  [[Res] SMD 0603]  (hidden comment: [1k] SMD 0603 1% 1/10W)
R15  Wattage: 1/10W  Tolerance: 1%  Resistance: 1k  Size Package: 0603  [[Res] SMD 0603]  (hidden comment: [1k] SMD 0603 1% 1/10W)
R16  Wattage: 1/10W  Tolerance: 1%  Resistance: 1k  Size Package: 0603  [[Res] SMD 0603]  (hidden comment: [1k] SMD 0603 1% 1/10W)
R17  Wattage: 1/10W  Tolerance: 1%  Resistance: 100  Size Package: 0603  [[Res] SMD 0603]  (hidden comment: [100] SMD 0603 1% 1/10W)
R18  Wattage: 1/10W  Tolerance: 1%  Resistance: 1k  Size Package: 0603  [[Res] SMD 0603]  (hidden comment: [1k] SMD 0603 1% 1/10W)
RT1  Mounting Style: Thru-Hole  Technology: NTC  Res at 25degC: 10k  [[NTC] 10k Thru-Hole]  (hidden comment: [NTC] 10k Thru-Hole)
RT2  Mounting Style: Thru-Hole  Technology: NTC  Res at 25degC: 10k  [[NTC] 10k Thru-Hole]  (hidden comment: [NTC] 10k Thru-Hole)
S1  [SPST] SMD Pushbutton  [[SPST] SMD Pushbutton]
U6  BQ7693003DBTR  [FP-DBT0030A-MFG]
U7  AOB290L  [TO-263-3_AOS]
X1  2pin Screw Terminal  [[Screw Terminal] 2pin 5mm]  (value not drawn)
X3  [JST] 7pin 90deg 2.54mm pitch  [[JST] 7pin 90deg 2.54mm pitch]  (value not drawn)

### Blocks framed on the sheet
Alert Pin Low-Pass RC Filter: C9 R6

### Nets
+5V: X1.1
BAT: C5.2 D1.1(K) R3.1 U6.15(BAT)
GND: C7.1 C9.1 C12.1 C19.1 C20.2 C21.1 C22.1 R16.1 RT2.1 U6.3(VSS) U6.28(SRP) U6.29(SRN) X1.2 X3.7
ALERT_PIN: R6.1 U6.30(ALERT)
Batt_Mon_Alert: C9.2 R6.2  [also labelled GP21]
Cell1: R15.1 X3.6
Cell2: R14.1 X3.5
Cell3: R13.1 X3.4
Cell4: R12.1 X3.3
Cell5: R11.1 R17.1 R18.1 X3.2  [also labelled Net_A]
Cell6: R10.1 X3.1
Cell7: R8.1
Cell8: R7.1
Cell9: R5.1
Cell10: R3.2 R4.1 U7.2(D)
GP22: U6.4(SDA)  [also labelled SDA_BM]
GP23: U6.5(SCL)  [also labelled SCL_BM]
REGOUT: C7.2 U6.8(REGOUT)
REGSRC: C21.2 U6.9(REGSRC) U7.3(S)
TS1: R9.1 RT2.2 U6.6(TS1)
TS2: RT1.1 U6.13(TS2)
VC0: C20.1 R16.2 U6.27(VC0)
VC1: C18.1 C19.2 R15.2 S1.2 U6.26(VC1)
VC2: C17.1 C18.2 R14.2
VC3: C16.1 C17.2 R13.2
VC4: C15.1 C16.2 R12.2
VC5: C15.2 D2.2(A) R11.2 U6.22(VC5)
VC5B: C14.1 R18.2 U6.21(VC5B)
VC5x: C5.1 C11.1 C14.2 C22.2 C23.1 D2.1(K) R17.2 RT1.2 U6.10(VC5x) U7.1(G)
VC6: C13.1 C23.2 R10.2 U6.20(VC6)
VC7: C10.1 C13.2 R8.2
VC8: C8.1 C10.2 R7.2
VC9: C6.1 C8.2 R5.2
VC10: C6.2 D1.2(A) R4.2 U6.16(VC10)
NetC11_2: C11.2 U6.11(NC) U6.12(NC) U6.14(CAP2)
NetC12_2: C12.2 U6.7(CAP1)
NetR9_2: R9.2 S1.1
NetU6_17: U6.17(VC9) U6.18(VC8) U6.19(VC7)
NetU6_23: U6.23(VC4) U6.24(VC3) U6.25(VC2)

Not connected (* = marked no-connect by the designer): U6 1(DSG)* 2(CHG)*

### Notes on the sheet
- Screw Terminal for +5V
- BQ7692 IC
- Datasheet (9.1.7)
  SRP, SRN: When not used, connect to VSS.
  DSG, CHG: Outputs, May be left unconnected if not used.
  REGOUT: LDO is 3.3V for BQ7693003DBTR.
- TS1 must have a rising edge to boot the part.

### Library data of the parts
C5 C22 = CMP-06035-056560-1: GCM32EC71H106MA03K Ceramic Capacitor for Automotive 10uF ±20% 50VDC X7S 1210 Embossed T/R
C6 C8 C10-C21 C23 = [Cap] 0603 1uF 10% 25V: CL10B105KA8NNNC; Supplier 1: DigiKey; Supplier Part Number 1: 1276-1184-1-ND
C7 = [Cap] 0603 4.7uF 10% 25V: GRM188R61E475KE11D; Supplier 1: DigiKey; Supplier Part Number 1: 490-7203-6-ND
C9 = [Cap] 0603 470pF 5% 50V: CL10C471JB8NNNC; Supplier 1: DigiKey; Supplier Part Number 1: 1276-1168-1-ND
D1 D2 = [Schottky] SMD 40V 1A: B5819W-TP; Supplier 1: DigiKey; Supplier Part Number 1: B5819W-TPMSCT-ND
R3 R17 = [100] SMD 0603 1% 1/10W: RC0603FR-07100RL; Supplier 1: DigiKey; Supplier Part Number 1: 311-100HRDKR-ND
R4 R5 R7 R8 R10-R16 R18 = [1k] SMD 0603 1% 1/10W: RMCF0603FT1K00; Supplier 1: DigiKey; Supplier Part Number 1: RMCF0603FT1K00DKR-ND
R6 = [499k] SMD 0603 1% 1/8W: CRCW0603499KFKEA; Supplier 1: DigiKey; Supplier Part Number 1: 541-499KHDKR-ND
R9 = [10k] SMD 0603 1% 1/8W: RMCF0603FT10K0; Supplier 1: DigiKey; Supplier Part Number 1: RMCF0603FT10K0DKR-ND
RT1 RT2 = [NTC] 10k Thru-Hole: B57164K0103J000; Supplier 1: DigiKey; Supplier Part Number 1: 495-2080-ND
S1 = [SPST] SMD Pushbutton: PTS815SJM250SMTRLFS; Supplier 1: DigiKey; Supplier Part Number 1: CKN12215-6-ND
U6 = CMP-04911-000006-1: IC BATT MGMT LI-ION AFE 30TSSOP; Manufacturer: Texas Instruments; Max Supply Voltage: 25V; Nominal Supply Current: 40-130uA; Number Of Outputs: 2; Number Of Cells: 10; Standoff Height: 0.05mm; Min Supply Voltage: 6V; Octopart: https://octopart.com/bq7693003dbtr-texas+instruments-34472212; Digikey Description: IC BATT MGMT LI-ION AFE 30TSSOP; Ipc Land Pattern Name: SOP50P635X120-30; Mouser Description: 6 to 10-Series Cell Li-Ion and Li-Phosphate Battery Monitor (bq76940 Family) 30-TSSOP -40 to 85; Package: DBT0030A; Manufacturer Part Number: BQ7693003DBTR; Device Class L1: Integrated Circuits (ICs); Temperature Range High: +85°C; RoHS: TRUE; Category: IC; Temperature: -40°C to +85°C; Automotive: No; Device Class L3: Battery Management; ComponentLink2Description: Datasheet; Device Class L2: Power Management ICs; ComponentLink2URL: http://www.ti.com/lit/ds/symlink/bq76930.pdf; Height: 1.2mm; Temperature Range Low: -40°C; Lead Free: Yes
U7 = AOB290L: Description; Manufacturer_Name: Alpha and Omega Semiconductor; Copyright: Copyright (C) 2025 Ultra Librarian. All rights reserved.; Manufacturer_Part_Number: AOB290L; RefDes: RefDes; Type: Type
X1 = [Screw Terminal] 2pin: TB002-500-02BE; Supplier 1: DigiKey; Supplier Part Number 1: 102-6145-ND

## Sheet RP2350A.SchDoc
size B; SheetNumber: 3; SheetTotal: 4
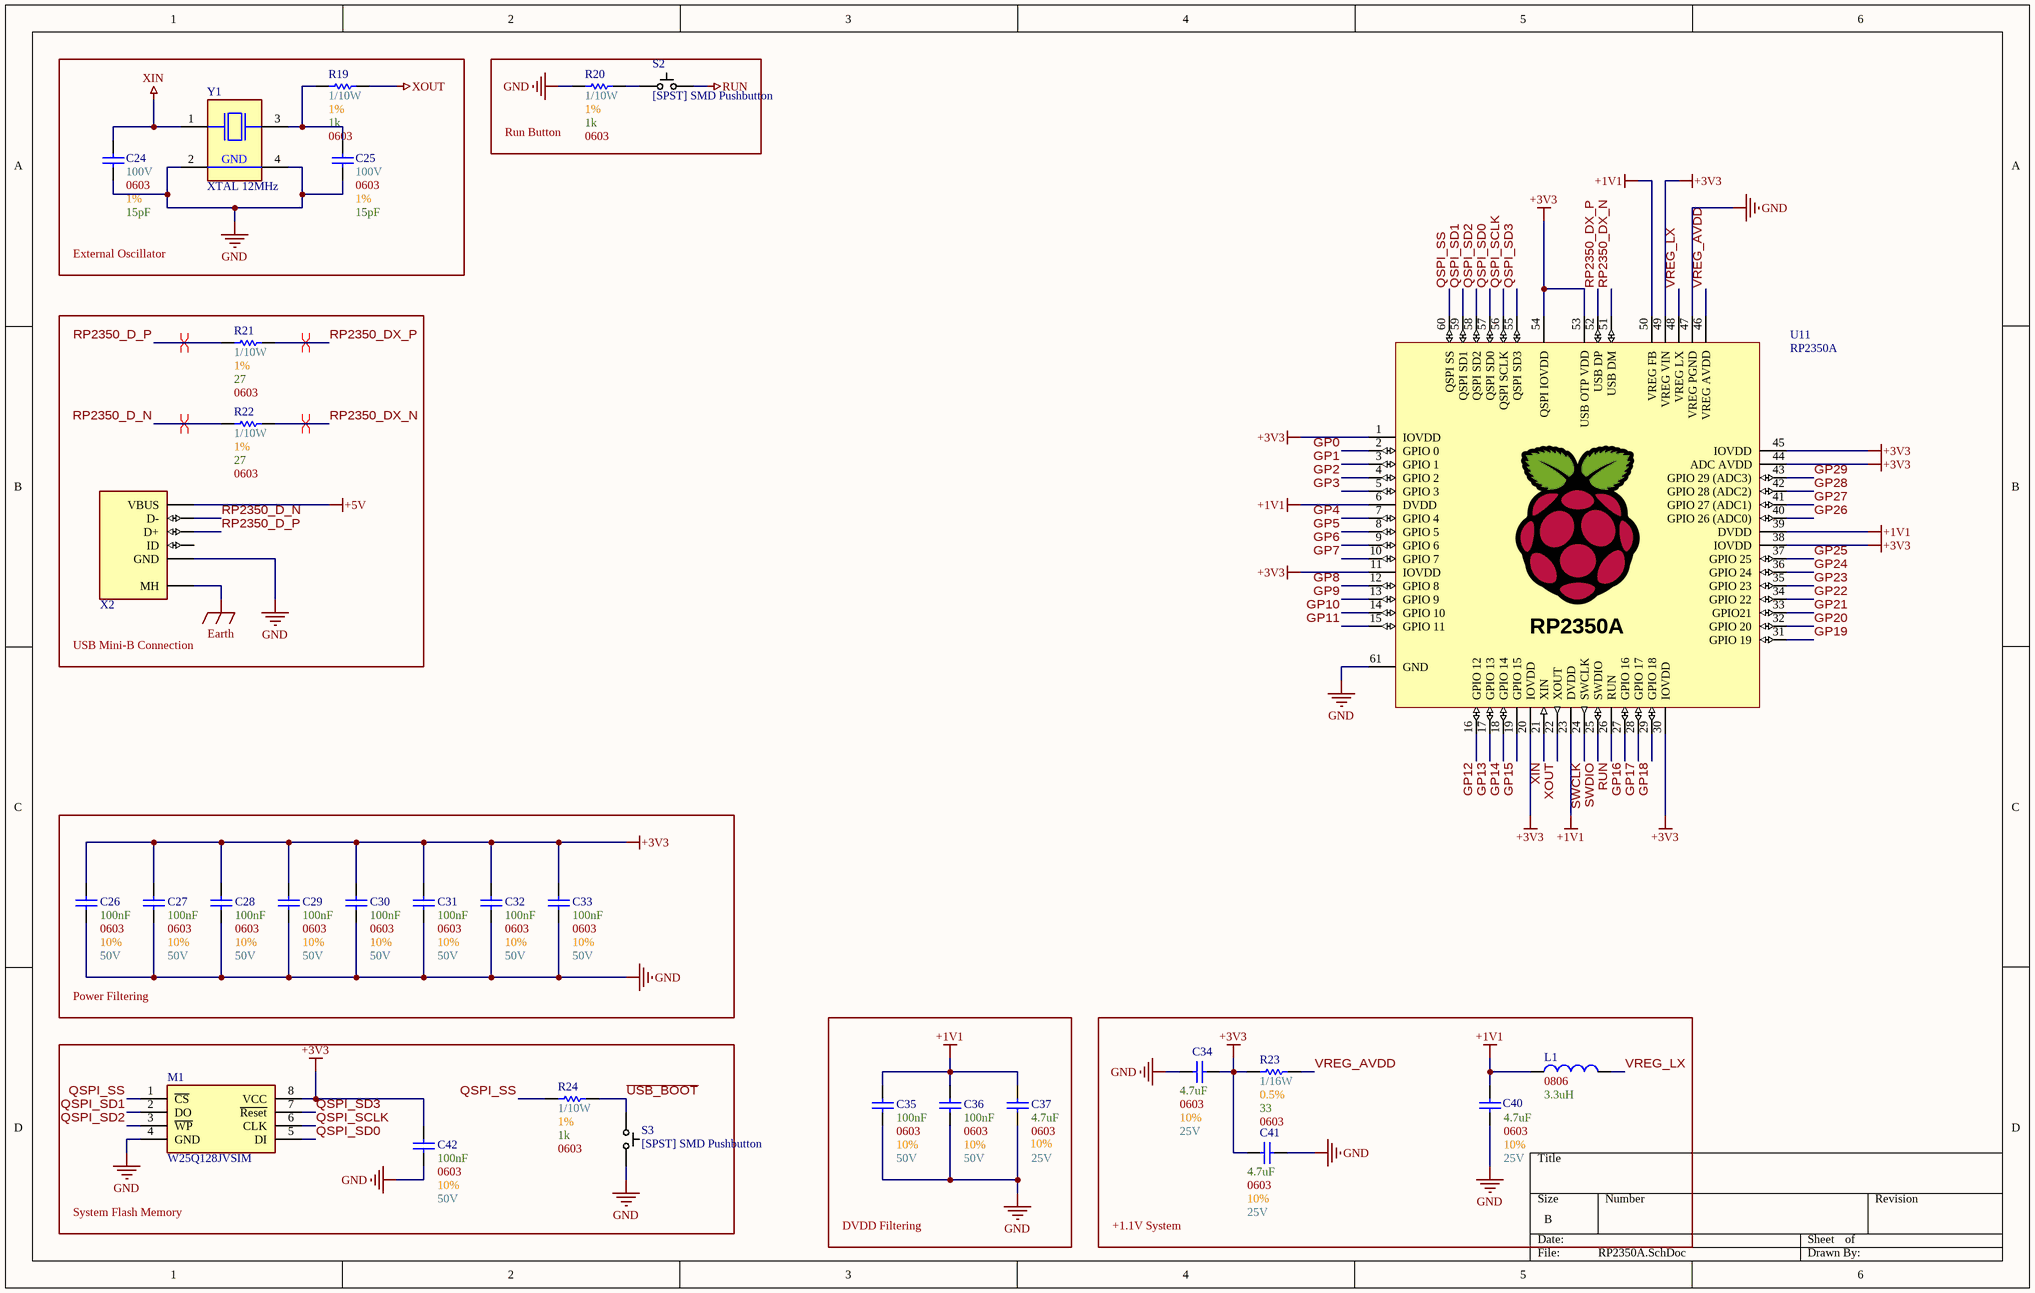
[diagram p3: RP2350A.SchDoc]

### Parts
C24  Max Voltage: 100V  Size Package: 0603  Tolerance: 1%  Capacitance: 15pF  [[Cap] SMD 0603]  (hidden comment: [Cap] 0603 15pF 1% 100V)
C25  Max Voltage: 100V  Size Package: 0603  Tolerance: 1%  Capacitance: 15pF  [[Cap] SMD 0603]  (hidden comment: [Cap] 0603 15pF 1% 100V)
C26  Max Voltage: 50V  Size Package: 0603  Tolerance: 10%  Capacitance: 100nF  [[Cap] SMD 0603]  (hidden comment: [Cap] 0603 0.1uF 10% 50V)
C27  Max Voltage: 50V  Size Package: 0603  Tolerance: 10%  Capacitance: 100nF  [[Cap] SMD 0603]  (hidden comment: [Cap] 0603 0.1uF 10% 50V)
C28  Max Voltage: 50V  Size Package: 0603  Tolerance: 10%  Capacitance: 100nF  [[Cap] SMD 0603]  (hidden comment: [Cap] 0603 0.1uF 10% 50V)
C29  Max Voltage: 50V  Size Package: 0603  Tolerance: 10%  Capacitance: 100nF  [[Cap] SMD 0603]  (hidden comment: [Cap] 0603 0.1uF 10% 50V)
C30  Max Voltage: 50V  Size Package: 0603  Tolerance: 10%  Capacitance: 100nF  [[Cap] SMD 0603]  (hidden comment: [Cap] 0603 0.1uF 10% 50V)
C31  Max Voltage: 50V  Size Package: 0603  Tolerance: 10%  Capacitance: 100nF  [[Cap] SMD 0603]  (hidden comment: [Cap] 0603 0.1uF 10% 50V)
C32  Max Voltage: 50V  Size Package: 0603  Tolerance: 10%  Capacitance: 100nF  [[Cap] SMD 0603]  (hidden comment: [Cap] 0603 0.1uF 10% 50V)
C33  Max Voltage: 50V  Size Package: 0603  Tolerance: 10%  Capacitance: 100nF  [[Cap] SMD 0603]  (hidden comment: [Cap] 0603 0.1uF 10% 50V)
C34  Max Voltage: 25V  Size Package: 0603  Tolerance: 10%  Capacitance: 4.7uF  [[Cap] SMD 0603]  (hidden comment: [Cap] 0603 4.7uF 10% 25V)
C35  Max Voltage: 50V  Size Package: 0603  Tolerance: 10%  Capacitance: 100nF  [[Cap] SMD 0603]  (hidden comment: [Cap] 0603 0.1uF 10% 50V)
C36  Max Voltage: 50V  Size Package: 0603  Tolerance: 10%  Capacitance: 100nF  [[Cap] SMD 0603]  (hidden comment: [Cap] 0603 0.1uF 10% 50V)
C37  Max Voltage: 25V  Size Package: 0603  Tolerance: 10%  Capacitance: 4.7uF  [[Cap] SMD 0603]  (hidden comment: [Cap] 0603 4.7uF 10% 25V)
C40  Max Voltage: 25V  Size Package: 0603  Tolerance: 10%  Capacitance: 4.7uF  [[Cap] SMD 0603]  (hidden comment: [Cap] 0603 4.7uF 10% 25V)
C41  Max Voltage: 25V  Size Package: 0603  Tolerance: 10%  Capacitance: 4.7uF  [[Cap] SMD 0603]  (hidden comment: [Cap] 0603 4.7uF 10% 25V)
C42  Max Voltage: 50V  Size Package: 0603  Tolerance: 10%  Capacitance: 100nF  [[Cap] SMD 0603]  (hidden comment: [Cap] 0603 0.1uF 10% 50V)
L1  Package: 0806  Inductance: 3.3uH  [[Inductor] SMD 0806]  (hidden comment: [3.3uH] SMD 0806 2.1A)
M1  W25Q128JVSIM  [[Flash] 128MBit]
R19  Wattage: 1/10W  Tolerance: 1%  Resistance: 1k  Size Package: 0603  [[Res] SMD 0603]  (hidden comment: [1k] SMD 0603 1% 1/10W)
R20  Wattage: 1/10W  Tolerance: 1%  Resistance: 1k  Size Package: 0603  [[Res] SMD 0603]  (hidden comment: [1k] SMD 0603 1% 1/10W)
R21  Wattage: 1/10W  Tolerance: 1%  Resistance: 27  Size Package: 0603  [[Res] SMD 0603]  (hidden comment: [27] SMD 0603 1% 1/10W)
R22  Wattage: 1/10W  Tolerance: 1%  Resistance: 27  Size Package: 0603  [[Res] SMD 0603]  (hidden comment: [27] SMD 0603 1% 1/10W)
R23  Wattage: 1/16W  Tolerance: 0.5%  Resistance: 33  Size Package: 0603  [[Res] SMD 0603]  (hidden comment: [33] SMD 0603 0.5% 1/16W)
R24  Wattage: 1/10W  Tolerance: 1%  Resistance: 1k  Size Package: 0603  [[Res] SMD 0603]  (hidden comment: [1k] SMD 0603 1% 1/10W)
S2  [SPST] SMD Pushbutton  [[SPST] SMD Pushbutton]
S3  [SPST] SMD Pushbutton  [[SPST] SMD Pushbutton]
U11  RP2350A  [[MCU] RP2350A]
X2  [USB] Type-B Mini  [[USB] Type-B Mini]  (value not drawn)
Y1  XTAL 12MHz  [[Crystal] SMD 12MHz]

### Blocks framed on the sheet
External Oscillator: C24 C25 R19 Y1
Run Button: R20 S2
USB Mini-B Connection: R21 R22 X2
Power Filtering: C26-C33
DVDD Filtering: C35-C37
+1.1V System: C34 C40 C41 L1 R23
System Flash Memory: C42 M1 R24 S3

### Nets
+1V1: C35.2 C36.2 C37.2 C40.1 L1.1 U11.6(DVDD) U11.23(DVDD) U11.39(DVDD) U11.50(VREG_FB)
+3V3: C26.2 C27.2 C28.2 C29.2 C30.2 C31.2 C32.2 C33.2 C34.1 C41.2 C42.2 M1.8(VCC) R23.1 U11.1(IOVDD) U11.11(IOVDD) U11.20(IOVDD) U11.30(IOVDD) U11.38(IOVDD) U11.44(ADC_AVDD) U11.45(IOVDD) U11.49(VREG_VIN) U11.53(USB_OTP_VDD) U11.54(QSPI_IOVDD)
+5V: X2.1(VBUS)
Earth: X2.MH
GND: C24.1 C25.1 C26.1 C27.1 C28.1 C29.1 C30.1 C31.1 C32.1 C33.1 C34.2 C35.1 C36.1 C37.1 C40.2 C41.1 C42.1 M1.4(GND) R20.1 S3.2 U11.47(VREG_PGND) U11.61(GND) X2.5(GND) Y1.2(GND) Y1.4(GND)
GP25: U11.37(GPIO_25)  [project net D_LOAD (~{CS}) 3V3]
GP26: U11.40(GPIO_26_(ADC0))  [project net SCK1 3V3]
GP27: U11.41(GPIO_27_(ADC1))  [project net MOSI1 3V3]
RUN: S2.2 U11.26(RUN)
XIN: C24.2 U11.21(XIN) Y1.1(XTAL1)
XOUT: R19.2 U11.22(XOUT)
GP0: U11.2(GPIO_0)
GP1: U11.3(GPIO_1)
GP2: U11.4(GPIO_2)
GP3: U11.5(GPIO_3)
GP4: U11.7(GPIO_4)
GP5: U11.8(GPIO_5)
GP6: U11.9(GPIO_6)
GP7: U11.10(GPIO_7)
GP8: U11.12(GPIO_8)
GP9: U11.13(GPIO_9)
GP10: U11.14(GPIO_10)
GP11: U11.15(GPIO_11)
GP12: U11.16(GPIO_12)
GP13: U11.17(GPIO_13)
GP14: U11.18(GPIO_14)
GP15: U11.19(GPIO_15)
GP16: U11.27(GPIO_16)
GP17: U11.28(GPIO_17)
GP18: U11.29(GPIO_18)
GP19: U11.31(GPIO_19)
GP20: U11.32(GPIO_20)
GP21: U11.33(GPIO21)  [project net Batt_Mon_Alert]
GP22: U11.34(GPIO_22)
GP23: U11.35(GPIO_23)
GP24: U11.36(GPIO_24)
GP28: U11.42(GPIO_28_(ADC2))
GP29: U11.43(GPIO_29_(ADC3))
QSPI_SCLK: M1.6(CLK) U11.56(QSPI_SCLK)
QSPI_SD0: M1.5(DI) U11.57(QSPI_SD0)
QSPI_SD1: M1.2(DO) U11.59(QSPI_SD1)
QSPI_SD2: M1.3(~{WP}) U11.58(QSPI_SD2)
QSPI_SD3: M1.7(~{Reset}) U11.55(QSPI_SD3)
QSPI_SS: M1.1(~{CS}) R24.1 U11.60(QSPI_SS)
RP2350_D_N: R22.1 X2.2(D-)
RP2350_D_P: R21.1 X2.3(D+)
RP2350_DX_N: R22.2 U11.51(USB_DM)
RP2350_DX_P: R21.2 U11.52(USB_DP)
SWCLK: U11.24(SWCLK)
SWDIO: U11.25(SWDIO)
~{USB_BOOT}: R24.2 S3.1
VREG_AVDD: R23.2 U11.46(VREG_AVDD)
VREG_LX: L1.2 U11.48(VREG_LX)
NetC25_2: C25.2 R19.1 Y1.3(XTAL2)
NetR20_2: R20.2 S2.1

Not connected (* = marked no-connect by the designer): X2 4(ID)

### Layout directives
differential pair: RP2350_D_N, RP2350_D_P, RP2350_DX_N, RP2350_DX_P

### Library data of the parts
C24 C25 = [Cap] 0603 15pF 1% 100V: GCM1885C2A150FA16D; Supplier 1: DigiKey; Supplier Part Number 1: 490-16416-1-ND
C26-C33 C35 C36 C42 = [Cap] 0603 0.1uF 10% 50V: CL10B104KB8NNNC; Supplier 1: DigiKey; Supplier Part Number 1: 1276-1000-6-ND
C34 C37 C40 C41 = [Cap] 0603 4.7uF 10% 25V: GRM188R61E475KE11D; Supplier 1: DigiKey; Supplier Part Number 1: 490-7203-6-ND
L1 = [3.3uH] SMD 0806 2.1A: AOTA-B201610S3R3-101-T; Supplier 1: DigiKey; Supplier Part Number 1: 535-AOTA-B201610S3R3-101-TCT-ND
M1 = [Flash] 128MBit: Supplier 1: DigiKey; Supplier Part Number 1: W25Q128JVSIM-ND
R19 R20 R24 = [1k] SMD 0603 1% 1/10W: RMCF0603FT1K00; Supplier 1: DigiKey; Supplier Part Number 1: RMCF0603FT1K00DKR-ND
R21 R22 = [27] SMD 0603 1% 1/10W: MCT06030C2709FP500; Supplier 1: DigiKey; Supplier Part Number 1: 749-1631-1-ND
R23 = [33] SMD 0603 0.5% 1/16W: RR0816Q-330-D; Supplier 1: DigiKey; Supplier Part Number 1: RR08Q33DDKR-ND
S2 S3 = [SPST] SMD Pushbutton: PTS815SJM250SMTRLFS; Supplier 1: DigiKey; Supplier Part Number 1: CKN12215-6-ND
U11 = [MCU] RP2350A: QFN-60 Package; Supplier 1: DigiKey; Supplier Part Number 1: 2648-SC1509-A4CT-ND
X2 = [USB] Type-B Mini: MUSB-05-S-B-SM-A-K-TR; Supplier 1: DigiKey; Supplier Part Number 1: SAM14226CT-ND
Y1 = [Crystal] SMD 12MHz: 815-ABM8-272-T3; Supplier 1: DigiKey; Supplier Part Number 1: 535-ABM8-272-T3CT-ND

## Sheet Battery-Current.SchDoc
size B; SheetNumber: 4; SheetTotal: 4
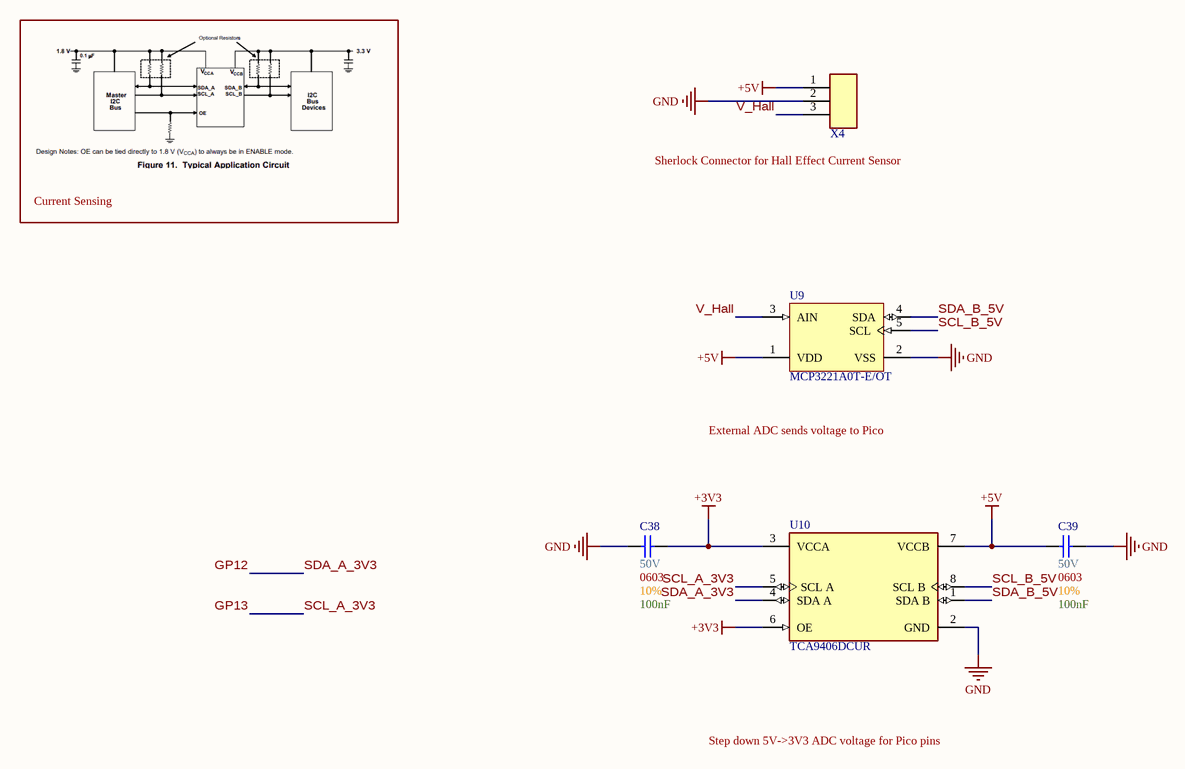
[diagram p4: Battery-Current.SchDoc]

### Parts
C38  Max Voltage: 50V  Size Package: 0603  Tolerance: 10%  Capacitance: 100nF  [[Cap] SMD 0603]  (hidden comment: [Cap] 0603 0.1uF 10% 50V)
C39  Max Voltage: 50V  Size Package: 0603  Tolerance: 10%  Capacitance: 100nF  [[Cap] SMD 0603]  (hidden comment: [Cap] 0603 0.1uF 10% 50V)
U9  MCP3221A0T-E/OT  [SOT-23-OT5_N]
U10  TCA9406DCUR  [FP-DCU0008A-IPC_B]
X4  [Sherlock] 3pin  [[Sherlock] 3pin]  (value not drawn)

### Nets
+3V3: C38.2 U10.3(VCCA) U10.6(OE)
+5V: C39.1 U9.1(VDD) U10.7(VCCB) X4.1
GND: C38.1 C39.2 U9.2(VSS) U10.2(GND) X4.2
GP12: U10.4(SDA_A)  [also labelled SDA_A_3V3]
GP13: U10.5(SCL_A)  [also labelled SCL_A_3V3]
SCL_B_5V: U9.5(SCL) U10.8(SCL_B)
SDA_B_5V: U9.4(SDA) U10.1(SDA_B)
V_Hall: U9.3(AIN) X4.3

### Notes on the sheet
- (near X4) Sherlock Connector for Hall Effect Current Sensor
- Current Sensing
- External ADC sends voltage to Pico
- Step down 5V->3V3 ADC voltage for Pico pins

### Library data of the parts
C38 C39 = [Cap] 0603 0.1uF 10% 50V: GCM155R71H104KE02J; Supplier 1: DigiKey; Supplier Part Number 1: 490-14514-6-ND
U9 = CMP-0188-00714-2: Low Power 12-Bit A/D Converter With I2C Interface, 5-Pin SOT-23, Extended Temperature, Tape and Reel; PackageVersion: revBB, Aug-2009; ComponentLink1URL: http://www.microchip.com/; ComponentLink1Description: Manufacturer URL; RevisionNote: URLs added.; ComponentLink3URL: http://www.microchip.com/stellent/groups/techpub_sg/documents/packagingspec/en012702.pdf; ComponentLink2Description: Datasheet; ComponentLink3Description: Package Specification; PackageReference: SOT-23-OT5; PackageDescription: 5-Lead Plastic Small Outline Transistor (OT) [SOT-23]; ComponentLink2URL: http://ww1.microchip.com/downloads/en/DeviceDoc/21732c.pdf; DatasheetVersion: revC, Jul-2006; Code_IPC: SOT23-5
U10 = CMP-0314-00417-3: IC TRNSLTR BIDIRECTIONAL US8; Propagation Delay: 4.4ns; Min Supply Voltage: 1.65V; Low Level Output Current: 50mA; Logic Function: Translator; Data Rate: 24Mbps; Turn-On Delay Time: 260ns; Max Supply Voltage: 5.5V; Number of Channels: 2; High Level Output Current: -50mA; Output Type: Voltage; Number of Pins: 8; Weight: 0.00067oz; Lead Free: Lead Free; Case/Package: VSSOP; Packaging: Tape and Reel; REACH SVHC: No SVHC; Package Quantity: 1; Length: 2.1mm; Contact Plating: Gold; Width: 2.4mm; Radiation Hardening: No; Number of Bits: 2; Height: 0.8mm; Number of Outputs: 2; Max Operating Temperature: 85°C; Min Operating Temperature: -40°C
X4 = [Sherlock] 3pin: 0353620350; Supplier 1: DigiKey; Supplier Part Number 1: WM18921-ND

## Nets that join several sheets
+3V3: Seven-Seg (C2.1 U1.2 U1.10), RP2350A (23 pins), Battery-Current (C38.2 U10.3 U10.6)
+5V: Seven-Seg (C1.1 R1.1 U1.19 U2.19), Battery-Voltage (X1.1), RP2350A (X2.1), Battery-Current (C39.1 U9.1 U10.7 X4.1)
D_LOAD (~{CS}) 3V3: Seven-Seg (U1.1), RP2350A (U11.37)
Earth: Seven-Seg (5 pins), RP2350A (X2.MH)
GND: Seven-Seg (11 pins), Battery-Voltage (14 pins), RP2350A (25 pins), Battery-Current (5 pins)
MOSI1 3V3: Seven-Seg (U1.4), RP2350A (U11.41)
SCK1 3V3: Seven-Seg (U1.3), RP2350A (U11.40)
Batt_Mon_Alert: Battery-Voltage (C9.2 R6.2), RP2350A (U11.33)
GP4: Seven-Seg (R25.1), RP2350A (U11.7)
GP5: Seven-Seg (R26.1), RP2350A (U11.8)
GP6: Seven-Seg (R27.1), RP2350A (U11.9)
GP7: Seven-Seg (R28.1), RP2350A (U11.10)
GP12: RP2350A (U11.16), Battery-Current (U10.4)
GP13: RP2350A (U11.17), Battery-Current (U10.5)
GP16: Seven-Seg (B1.1), RP2350A (U11.27)
GP22: Battery-Voltage (U6.4), RP2350A (U11.34)
GP23: Battery-Voltage (U6.5), RP2350A (U11.35)